# Altium schematic sheet [5] Ethernet.SchDoc
size B; Organization: Altium Limited; Address1: L3, 12a Rodborough Rd; Address2: Frenchs Forest; Address3: NSW; Address4: Australia 2086
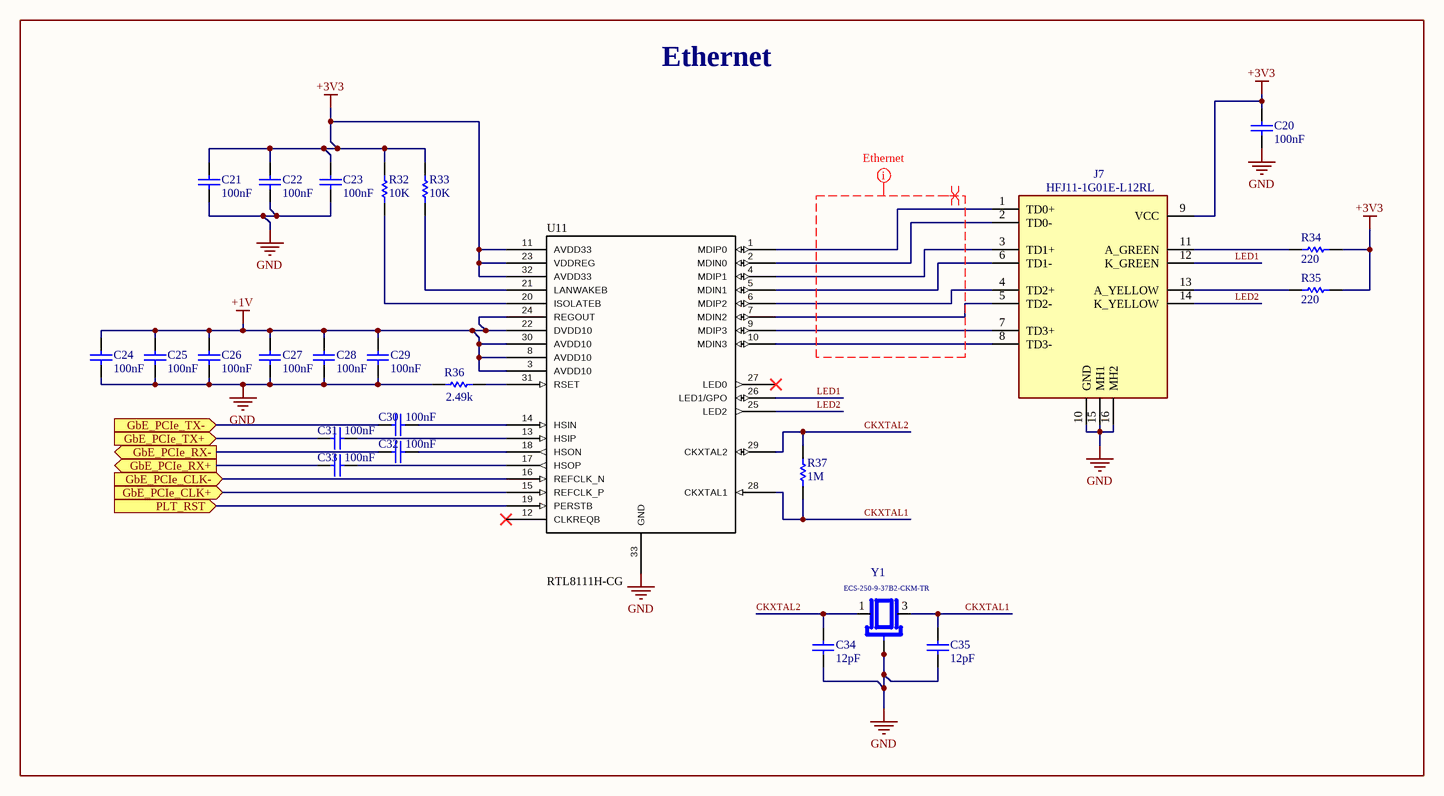
[diagram p0: [5] Ethernet.SchDoc]

## Parts
C20  100nF  [Capacitor 0402]
C21  100nF  [Capacitor 0402]
C22  100nF  [Capacitor 0402]
C23  100nF  [Capacitor 0402]
C24  100nF  [Capacitor 0402]
C25  100nF  [Capacitor 0402]
C26  100nF  [Capacitor 0402]
C27  100nF  [Capacitor 0402]
C28  100nF  [Capacitor 0402]
C29  100nF  [Capacitor 0402]
C30  100nF  [Capacitor 0402]
C31  100nF  [Capacitor 0402]
C32  100nF  [Capacitor 0402]
C33  100nF  [Capacitor 0402]
C34  12pF  [Capacitor 0402]
C35  12pF  [Capacitor 0402]
J7  HFJ11-1G01E-L12RL  [HFJ111G01EL12RL]
R32  10K  [Resistencia 0402]
R33  10K  [Resistencia 0402]
R34  220  [Resistencia 0402]
R35  220  [Resistencia 0402]
R36  2.49k  [Resistencia 0402]
R37  1M  [Resistencia 0402]
U11  RTL8111H-CG  [RTL8111H-CG]
Y1  ECS-250-9-37B2-CKM-TR  [XTAL_ECS-250-9-37B2-CKM-TR]

## Blocks framed on the sheet
Ethernet: C20-C35 J7 R32-R37 U11 Y1

## Ports
GbE_PCIe_CLK+ (in), GbE_PCIe_CLK- (in), GbE_PCIe_RX+ (out), GbE_PCIe_RX- (out), GbE_PCIe_TX+ (in), GbE_PCIe_TX- (in), PLT_RST (in)

## Nets
+1V: C24.2 C25.2 C26.2 C27.2 C28.2 C29.2 U11.3(AVDD10) U11.8(AVDD10) U11.22(DVDD10) U11.24(REGOUT) U11.30(AVDD10)
+3V3: C20.2 C21.2 C22.2 C23.2 J7.9(VCC) R32.2(B) R33.2(B) R34.1(A) R35.1(A) U11.11(AVDD33) U11.23(VDDREG) U11.32(AVDD33)
GND: C20.1 C21.1 C22.1 C23.1 C24.1 C25.1 C26.1 C27.1 C28.1 C29.1 C34.1 C35.1 J7.10(GND) J7.15(MH1) J7.16(MH2) R36.2(B) U11.33(GND) Y1.2(GND) Y1.4(GND)
CKXTAL1: C35.2 R37.2(B) U11.28(CKXTAL1) Y1.3(OUT/IN)
CKXTAL2: C34.2 R37.1(A) U11.29(CKXTAL2) Y1.1(IN/OUT)
GbE_PCIe_CLK+: U11.15(REFCLK_P) ; port GbE_PCIe_CLK+
GbE_PCIe_CLK-: U11.16(REFCLK_N) ; port GbE_PCIe_CLK-
GbE_PCIe_RX+: C33.2 ; port GbE_PCIe_RX+
GbE_PCIe_RX-: C32.2 ; port GbE_PCIe_RX-
GbE_PCIe_TX+: C31.2 ; port GbE_PCIe_TX+
GbE_PCIe_TX-: C30.2 ; port GbE_PCIe_TX-
LED1: J7.12(K_GREEN) U11.26(LED1/GPO)
LED2: J7.14(K_YELLOW) U11.25(LED2)
PLT_RST: U11.19(PERSTB) ; port PLT_RST
NetC30_1: C30.1 U11.14(HSIN)
NetC31_1: C31.1 U11.13(HSIP)
NetC32_1: C32.1 U11.18(HSON)
NetC33_1: C33.1 U11.17(HSOP)
NetJ7_1: J7.1(TD0+) U11.1(MDIP0)
NetJ7_2: J7.2(TD0-) U11.2(MDIN0)
NetJ7_3: J7.3(TD1+) U11.4(MDIP1)
NetJ7_4: J7.4(TD2+) U11.6(MDIP2)
NetJ7_5: J7.5(TD2-) U11.7(MDIN2)
NetJ7_6: J7.6(TD1-) U11.5(MDIN1)
NetJ7_7: J7.7(TD3+) U11.9(MDIP3)
NetJ7_8: J7.8(TD3-) U11.10(MDIN3)
NetJ7_11: J7.11(A_GREEN) R34.2(B)
NetJ7_13: J7.13(A_YELLOW) R35.2(B)
NetR32_1: R32.1(A) U11.20(ISOLATEB)
NetR33_1: R33.1(A) U11.21(LANWAKEB)
NetR36_1: R36.1(A) U11.31(RSET)

Not connected (* = marked no-connect by the designer): U11 12(CLKREQB)* 27(LED0)*

## Layout directives
mark named Ethernet: (no net found under the mark)
differential pair; differential pair class 100_OHM_DIFF: (no net found under the mark)

## Notes on the sheet
- Title
- Size:
- Date:
- B
- Number:
- Time:
- Revision:
- Sheet
- of
- File:

## Library data of the parts
C20-C35 = Capacitor 0402: Capacitor Ceramico SMD 0402
J7 = HFJ11-1G01E-L12RL: Modular Connectors / Ethernet Connectors GIGABIT 1x1 Tab Down RJ45 w/mag Y/G LED 350uH min 0C ~ 70C; Manufacturer_Name: Halo Electronics; Geometry.Height: 15.64mm; Mouser Part Number: 493-HFJ111G01EL12RL; Mouser Price/Stock: https://www.mouser.co.uk/ProductDetail/HALO-Electronics/HFJ11-1G01E-L12RL?qs=8uu3sA0mUdsaxIpTwn1s5A%3D%3D; Manufacturer_Part_Number: HFJ11-1G01E-L12RL; Datasheet Link: https://www.haloelectronics.com/pdf/fastjack-gigabit.pdf
R32-R37 = Resistencia SMD 0402
U11 = RTL8111H-CG: Realtek RTL8111H-CG - controlador Ethernet 10/100/1000M integrado para PCI Express, QFN-32 4x4 mm paso 0.4 mm, regulador LDO; Manufacturer: Realtek Semiconductor; Manufacturer Part Number: RTL8111H-CG; Package: QFN-32, 4x4 mm, 0.4 mm pitch, EP 2.7 mm (JEDEC MO-220); Datasheet: Realtek RTL8111H/RTL8111HS Datasheet rev 1.2
Y1 = ECS-250-9-37B2-CKM-TR: Crystal 25MHz Â±10ppm (Tol) Â±10ppm (Stability) 9pF FUND 50Ohm 4-Pin Mini-CSMD T/R; MF: ECS Inc.; SnapEDA_Link: https://www.snapeda.com/parts/ECS-250-9-37B2-CKM-TR/ECS/view-part/?ref=snap; Package: ECX-1637B-37B-4 ECS; Value: *; MP: ECS-250-9-37B2-CKM-TR; Check_prices: https://www.snapeda.com/parts/ECS-250-9-37B2-CKM-TR/ECS/view-part/?ref=eda